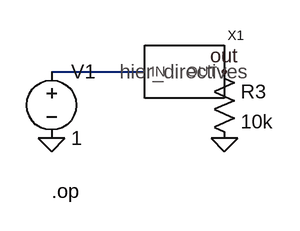
[diagram p0: schematic hier_directives_top.asc]
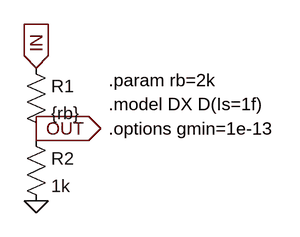
[diagram p1: sub-circuit hier_directives.asc]
hier_directives_top.asc, the LTspice schematic file:
Version 4
SHEET 1 880 680
WIRE 0 16 112 16
FLAG 0 96 0
FLAG 208 16 out
FLAG 208 96 0
SYMBOL voltage 0 0 R0
SYMATTR InstName V1
SYMATTR Value 1
SYMBOL hier_directives 160 16 R0
SYMATTR InstName X1
SYMBOL res 192 0 R0
SYMATTR InstName R3
SYMATTR Value 10k
TEXT 0 160 Left 2 !.op

hier_directives.asc, the sub-circuit schematic file:
Version 4
SHEET 1 880 680
WIRE 0 96 0 112
FLAG 0 16 IN
IOPIN 0 16 In
FLAG 0 96 OUT
IOPIN 0 96 Out
FLAG 0 192 0
SYMBOL res -16 0 R0
SYMATTR InstName R1
SYMATTR Value {rb}
SYMBOL res -16 96 R0
SYMATTR InstName R2
SYMATTR Value 1k
TEXT 96 32 Left 2 !.param rb=2k
TEXT 96 64 Left 2 !.model DX D(Is=1f)
TEXT 96 96 Left 2 !.options gmin=1e-13

The netlist it stands for:
* hier_directives_top.asc
V1 N001 0 1
XX1 N001 out hier_directives
R3 out 0 10k

* block symbol definitions
.subckt hier_directives IN OUT
R1 IN OUT {rb}
R2 OUT 0 1k
.param rb=2k
.model DX D(Is=1f)
.options gmin=1e-13
.ends hier_directives

.op
.backanno
.end